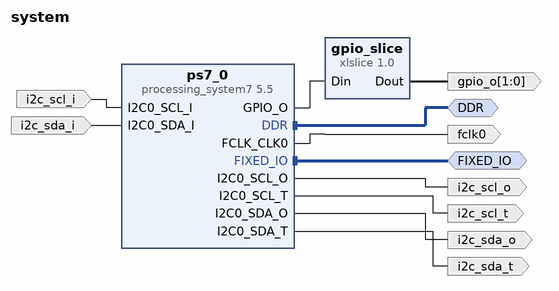
[diagram p0: block diagram of the top level]
# Vivado block design system, xc7z010clg400-1, Vivado 2025.2
create_bd_design system

create_bd_intf_port -mode Master -vlnv xilinx.com:interface:ddrx_rtl:1.0 DDR
create_bd_intf_port -mode Master -vlnv xilinx.com:display_processing_system7:fixedio_rtl:1.0 FIXED_IO
create_bd_port -dir O -type clk fclk0
create_bd_port -dir O -from 1 -to 0 gpio_o
create_bd_port -dir I i2c_scl_i
create_bd_port -dir O i2c_scl_o
create_bd_port -dir O i2c_scl_t
create_bd_port -dir I i2c_sda_i
create_bd_port -dir O i2c_sda_o
create_bd_port -dir O i2c_sda_t

create_bd_cell -type ip -vlnv xilinx.com:ip:processing_system7:5.5 ps7_0
set_property -dict [list \
  CONFIG.PCW_FPGA0_PERIPHERAL_FREQMHZ 200 \
  CONFIG.PCW_GPIO_EMIO_GPIO_ENABLE 1 \
  CONFIG.PCW_GPIO_EMIO_GPIO_IO EMIO \
  CONFIG.PCW_I2C0_I2C0_IO EMIO \
  CONFIG.PCW_I2C0_PERIPHERAL_ENABLE 1 \
  CONFIG.PCW_I2C_PERIPHERAL_FREQMHZ 111.111115 \
  CONFIG.PCW_SD0_GRP_CD_ENABLE 0 \
  CONFIG.PCW_SD0_GRP_WP_ENABLE 0 \
  CONFIG.PCW_SD0_PERIPHERAL_ENABLE 1 \
  CONFIG.PCW_SD0_SD0_IO {MIO 40 .. 45} \
  CONFIG.PCW_SDIO_PERIPHERAL_FREQMHZ 100 \
  CONFIG.PCW_UART1_PERIPHERAL_ENABLE 1 \
  CONFIG.PCW_UART1_UART1_IO {MIO 24 .. 25} \
  CONFIG.PCW_UART_PERIPHERAL_FREQMHZ 100 \
  CONFIG.PCW_UIPARAM_DDR_BUS_WIDTH {16 Bit} \
  CONFIG.PCW_UIPARAM_DDR_PARTNO {MT41K128M16 JT-125} \
  CONFIG.PCW_USE_M_AXI_GP0 0 \
] [get_bd_cells ps7_0]
# 67 more settings of ps7_0 are not shown: defaults, MIO pin electricals, DDR timing, and values the tool derives
create_bd_cell -type ip -vlnv xilinx.com:ip:xlslice:1.0 gpio_slice
set_property -dict {CONFIG.DIN_FROM 1 CONFIG.DIN_TO 0 CONFIG.DIN_WIDTH 64 CONFIG.DOUT_WIDTH 2} [get_bd_cells gpio_slice]

# ---- connections ----

connect_bd_intf_net [get_bd_intf_ports DDR] [get_bd_intf_pins ps7_0/DDR]
connect_bd_intf_net [get_bd_intf_ports FIXED_IO] [get_bd_intf_pins ps7_0/FIXED_IO]
connect_bd_net [get_bd_pins gpio_slice/Dout] [get_bd_ports gpio_o]
connect_bd_net [get_bd_ports i2c_scl_i] [get_bd_pins ps7_0/I2C0_SCL_I]
connect_bd_net [get_bd_ports i2c_sda_i] [get_bd_pins ps7_0/I2C0_SDA_I]
connect_bd_net [get_bd_pins ps7_0/FCLK_CLK0] [get_bd_ports fclk0]
connect_bd_net [get_bd_pins ps7_0/GPIO_O] [get_bd_pins gpio_slice/Din]
connect_bd_net [get_bd_pins ps7_0/I2C0_SCL_O] [get_bd_ports i2c_scl_o]
connect_bd_net [get_bd_pins ps7_0/I2C0_SCL_T] [get_bd_ports i2c_scl_t]
connect_bd_net [get_bd_pins ps7_0/I2C0_SDA_O] [get_bd_ports i2c_sda_o]
connect_bd_net [get_bd_pins ps7_0/I2C0_SDA_T] [get_bd_ports i2c_sda_t]

validate_bd_design
save_bd_design
